# Altium project SoM_RK3588.PrjPcb (part 6 of 6)
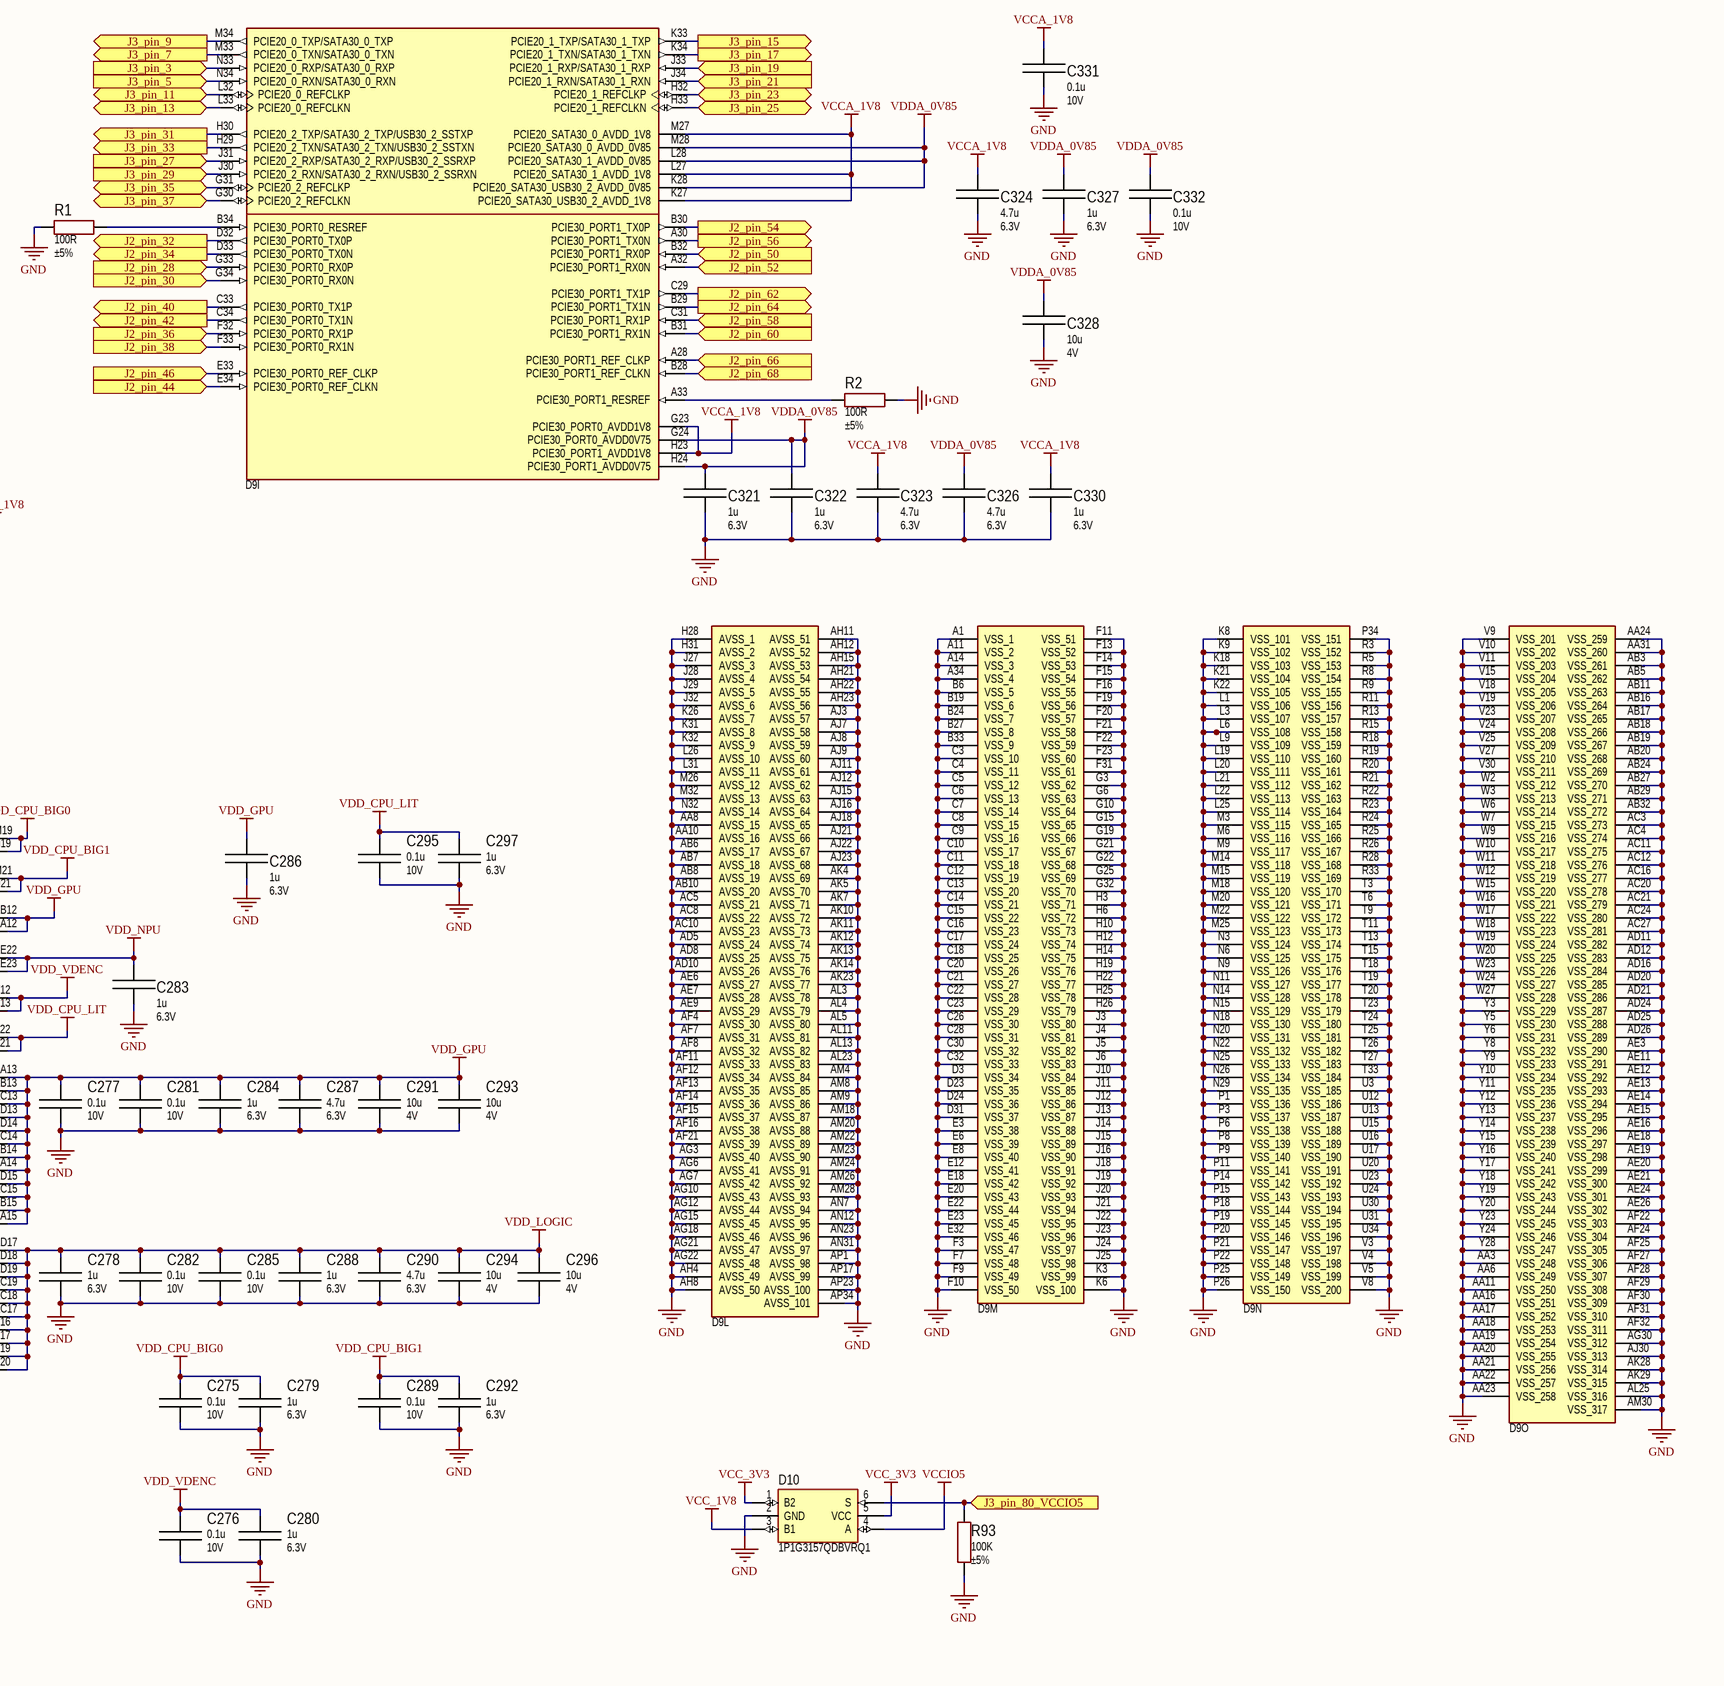
[diagram p25: 06_RK3588MQ.SchDoc, bottom right]

## Sheet 06_RK3588MQ.SchDoc (continued)

### Library data of the parts
C193 C197 = C1005C0G1H180J050BA: Ceramic capacitor, 18pF, C0G, ±5%, 50V, 0402, -55...+125°C; Manufacturer: TDK; Type: Ceramic SMD; PartNumber: C1005C0G1H180J050BA; Dielectric: C0G; Tolerance: ±5%; Temperature: -55...+125°C; Package: 0402; ComponentLink1Description: Link; ComponentLink1URL: https://product.tdk.com/en/system/files/dam/doc/product/capacitor/ceramic/mlcc/catalog/mlcc_commercial_general_en.pdf; ComponentLink2Description: LocalLink; ComponentLink2URL: C:\Users\Public\Documents\Altium\datasheet\Capacitors\mlcc_commercial_general_en.pdf
C194 C196 C200 C204 C207 C209-C211 C215 C217 C228 C233 C236 C240 C247 C257-C259 C261-C263 C265 C266 C278-C280 C283 C284 C286 C288 C292 C297 C304 C310 C313 C317 C319 C321 C322 C327 C330 = C0603X5R0J105M030BC: Ceramic capacitor, 1uF, X5R, ±20%, 6.3V, 0201, -55...+85°C; Manufacturer: TDK; Type: Ceramic SMD; PartNumber: C0603X5R0J105M030BC; Dielectric: X5R; Tolerance: ±20%; Temperature: -55...+85°C; Package: 0201; ComponentLink1Description: Link; ComponentLink1URL: https://product.tdk.com/system/files/dam/doc/product/capacitor/ceramic/mlcc/catalog/mlcc_commercial_general_en.pdf; ComponentLink2Description: LocalLink; ComponentLink2URL: C:\Users\Public\Documents\Altium\datasheet\Capacitors\mlcc_commercial_general_en.pdf
C195 C198 C199 C201-C203 C212 C214 C219 C220 C223 C241 C246 C253 C254 C260 C267-C272 C274-C277 C281 C282 C285 C289 C295 C303 C305-C309 C311 C314 C316 C325 C329 C331-C352 = C0603X5R1A104K030BC: Ceramic capacitor, 0.1uF, X5R, ±10%, 10V, 0201, -55...+85°C; Manufacturer: TDK; Type: Ceramic SMD; PartNumber: C0603X5R1A104K030BC; Dielectric: X5R; Tolerance: ±10%; Temperature: -55...+85°C; Package: 0201; ComponentLink1Description: Link; ComponentLink1URL: https://product.tdk.com/system/files/dam/doc/product/capacitor/ceramic/mlcc/catalog/mlcc_commercial_general_en.pdf; ComponentLink2Description: LocalLink; ComponentLink2URL: C:\Users\Public\Documents\Altium\datasheet\Capacitors\mlcc_commercial_general_en.pdf
C205 C206 C227 C230 C243-C245 C249 C252 C255 C256 C291 C293 C294 C296 C328 = CC0402MRX5R4BB106: Ceramic capacitor, 10uF, X5R, ±20%, 4V, 0402, -55...+85°C; Manufacturer: Yageo; Type: Ceramic SMD; Tolerance: ±5%; PartNumber: CC0402MRX5R4BB106; Dielectric: X5R; Temperature: -55...+85°C; Package: 0402; ComponentLink1Description: Link; ComponentLink1URL: https://www.yageo.com/upload/media/product/productsearch/datasheet/mlcc/UPY-GPHC_X5R_4V-to-50V_30.pdf; ComponentLink2Description: LocalLink; ComponentLink2URL: C:\Users\Public\Documents\Altium\datasheet\Capacitors\UPY-GPHC_X5R_4V-to-50V_30.pdf
C208 C234 C250 C251 C264 C287 C290 C312 C318 C320 C323 C324 C326 = C1005X5R0J475K050BC: Ceramic capacitor, 4,7uF, X5R, ±10%, 6.3V, 0402, -55...+85°C; Manufacturer: TDK; Type: Ceramic SMD; PartNumber: C1005X5R0J475K050BC; Dielectric: X5R; Tolerance: ±10%; Temperature: -55...+85°C; Package: 0402; ComponentLink1Description: Link; ComponentLink1URL: https://product.tdk.com/en/system/files/dam/doc/product/capacitor/ceramic/mlcc/catalog/mlcc_commercial_general_en.pdf; ComponentLink2Description: LocalLink; ComponentLink2URL: C:\Users\Public\Documents\Altium\datasheet\Capacitors\mlcc_commercial_general_en.pdf
C225 C232 C235 C248 = C1608X5R0J226M080AC: Ceramic capacitor, 22uF, X5R, ±20%, 6.3V, 0603, -55...+85°C; Manufacturer: TDK; Type: Ceramic SMD; PartNumber: C1608X5R0J226M080AC; Dielectric: X5R; Tolerance: ±20%; Temperature: -55...+85°C; Package: 0603; ComponentLink1Description: Link; ComponentLink1URL: https://product.tdk.com/system/files/dam/doc/product/capacitor/ceramic/mlcc/catalog/mlcc_commercial_general_en.pdf; ComponentLink2Description: LocalLink; ComponentLink2URL: C:\Users\Public\Documents\Altium\datasheet\Capacitors\mlcc_commercial_general_en.pdf
C273 = C1608X5R0J106K080AB: Ceramic capacitor, 10uF, X5R, ±10%, 6.3V, 0603, -55...+85°C; Manufacturer: TDK; Type: Ceramic SMD; PartNumber: C1608X5R0J106K080AB; Dielectric: X5R; Tolerance: ±10%; Temperature: -55...+85°C; Package: 0603; ComponentLink1Description: Link; ComponentLink1URL: https://product.tdk.com/system/files/dam/doc/product/capacitor/ceramic/mlcc/catalog/mlcc_commercial_general_en.pdf; ComponentLink2Description: LocalLink; ComponentLink2URL: C:\Users\Public\Documents\Altium\datasheet\Capacitors\mlcc_commercial_general_en.pdf
D9 = RK3588M: A high perfomance, low power AIoT processor; Manufacturer: Rockchip; PartNumber: RK3588M; Type: Processor; Package: FCBGA1088L; ComponentLink1Description: New link; ComponentLink1URL: C:\Users\Public\Documents\Altium\Datasheet\ICs\Rockchip_RK3588_Datasheet_V1.3-20220328.pdf; Temperature: -40...+125°C
D10 = 1P1G3157QDBVRQ1: Automotive Single-Pole Double-Throw Analog Switch; Manufacturer: Texas Instruments; ComponentLink1Description: Link; ComponentLink1URL: https://www.ti.com/lit/ds/symlink/sn74lvc1g3157-q1.pdf?ts=1743508565257&ref_url=https%253A%252F%252Fwww.ti.com%252Fproduct%252FSN74LVC1G3157-Q1; ComponentLink2Description: LocalLink; ComponentLink2URL: C:\Users\Public\Documents\Altium\Datasheet\ICs\sn74lvc1g3157-q1.pdf; Type: Analog Switch; Temperature: -40...+125°C; Package: SOT-23 (6); PartNumber: 1P1G3157QDBVRQ1
R1 R2 = RC0402JR-07100RL: Resistor film, 100R, ±5%, 0402, 0.0625W, -55...+155°C; Manufacturer: Yageo; PartNumber: RC0402JR-07100RL; Type: Resistor film; Power: 0.0625W; ComponentLink1Description: Link; ComponentLink1URL: https://www.yageo.com/upload/media/product/productsearch/datasheet/rchip/PYu-RC_Group_51_RoHS_L_12.pdf; Temperature: -55...+155°C; Package: 0402; ComponentLink2Description: LocalLink; ComponentLink2URL: C:\Users\Public\Documents\Altium\Datasheet\Resistors\PYu-RC_Group_51_RoHS_L_12.pdf
R73 R76 R81 R82 = RC0201FR-07240RL: Resistor film, 240R, ±1%, 0201, 0.05W, -55...+125°C; Manufacturer: Yageo; PartNumber: RC0201FR-07240RL; Type: Resistor film; Power: 0.05W; ComponentLink1Description: Link; ComponentLink1URL: https://www.yageo.com/upload/media/product/productsearch/datasheet/rchip/PYu-RC_Group_51_RoHS_L_12.pdf; Temperature: -55...+125°C; Package: 0201; ComponentLink2Description: LocalLink; ComponentLink2URL: C:\Users\Public\Documents\Altium\Datasheet\Resistors\PYu-RC_Group_51_RoHS_L_12.pdf
R74 R77 R87 R91 = RC0402JR-0722RL: Resistor film, 22R, ±5%, 0402, 0.0625W, -55...+155°C; Manufacturer: Yageo; PartNumber: RC0402JR-0722RL; Type: Resistor film; Power: 0.0625W; ComponentLink1Description: Link; ComponentLink1URL: https://www.yageo.com/upload/media/product/productsearch/datasheet/rchip/PYu-RC_Group_51_RoHS_L_12.pdf; Temperature: -55...+155°C; Package: 0402; ComponentLink2Description: LocalLink; ComponentLink2URL: C:\Users\Public\Documents\Altium\Datasheet\Resistors\PYu-RC_Group_51_RoHS_L_12.pdf
R75 = RC0402JR-07510KL: Resistor film, 510K, ±5%, 0402, 0.0625W, -55...+155°C; Manufacturer: Yageo; PartNumber: RC0402JR-07510KL; Type: Resistor film; Power: 0.0625W; ComponentLink1Description: Link; ComponentLink1URL: https://www.yageo.com/upload/media/product/productsearch/datasheet/rchip/PYu-RC_Group_51_RoHS_L_12.pdf; Temperature: -55...+155°C; Package: 0402; ComponentLink2Description: LocalLink; ComponentLink2URL: C:\Users\Public\Documents\Altium\Datasheet\Resistors\PYu-RC_Group_51_RoHS_L_12.pdf
R78 R85 R93 = RC0402JR-07100KL: Resistor film, 100K, ±5%, 0402, 0.0625W, -55...+155°C; Manufacturer: Yageo; PartNumber: RC0402JR-07100KL; Type: Resistor film; Power: 0.0625W; ComponentLink1Description: Link; ComponentLink1URL: https://www.yageo.com/upload/media/product/productsearch/datasheet/rchip/PYu-RC_Group_51_RoHS_L_12.pdf; Temperature: -55...+155°C; Package: 0402; ComponentLink2Description: LocalLink; ComponentLink2URL: C:\Users\Public\Documents\Altium\Datasheet\Resistors\PYu-RC_Group_51_RoHS_L_12.pdf
R79 R94-R97 = NC0402: NC, No BOM; PartNumber: NC; Type: Resistor film; Package: 0402
R80 R86 = RC0402JR-07120KL: Resistor film, 120K, ±5%, 0402, 0.0625W, -55...+155°C; Manufacturer: Yageo; PartNumber: RC0402JR-07120KL; Type: Resistor film; Power: 0.0625W; ComponentLink1Description: Link; ComponentLink1URL: https://www.yageo.com/upload/media/product/productsearch/datasheet/rchip/PYu-RC_Group_51_RoHS_L_12.pdf; Temperature: -55...+155°C; Package: 0402; ComponentLink2Description: LocalLink; ComponentLink2URL: C:\Users\Public\Documents\Altium\Datasheet\Resistors\PYu-RC_Group_51_RoHS_L_12.pdf
R83 R84 = RC0201JR-072K2L: Resistor film, 2K2, ±5%, 0201, 0.05W, -55...+125°C; Manufacturer: Yageo; PartNumber: RC0201JR-072K2L; Type: Resistor film; Power: 0.05W; ComponentLink1Description: Link; ComponentLink1URL: https://www.yageo.com/upload/media/product/productsearch/datasheet/rchip/PYu-RC_Group_51_RoHS_L_12.pdf; Temperature: -55...+125°C; Package: 0201; ComponentLink2Description: LocalLink; ComponentLink2URL: C:\Users\Public\Documents\Altium\Datasheet\Resistors\PYu-RC_Group_51_RoHS_L_12.pdf
R88 R89 = RC0603JR-070RL: Resistor film, 0R, 0603, 0.1W, -55...+155°C; Manufacturer: Yageo; PartNumber: RC0603JR-070RL; Type: Resistor film; Power: 0.1W; ComponentLink1Description: Link; ComponentLink1URL: https://www.yageo.com/upload/media/product/productsearch/datasheet/rchip/PYu-RC_Group_51_RoHS_L_12.pdf; Temperature: -55...+155°C; Package: 0603; ComponentLink2Description: LocalLink; ComponentLink2URL: C:\Users\Public\Documents\Altium\Datasheet\Resistors\PYu-RC_Group_51_RoHS_L_12.pdf
R90 R92 = RC0201JR-070RL: Resistor film, 0R, 0201, 0.05W, -55...+155°C; Manufacturer: Yageo; PartNumber: RC0201JR-070RL; Type: Resistor film; Power: 0.05W; ComponentLink1Description: Link; ComponentLink1URL: https://www.yageo.com/upload/media/product/productsearch/datasheet/rchip/PYu-RC_Group_51_RoHS_L_12.pdf; Temperature: -55...+155°C; Package: 0201; ComponentLink2Description: LocalLink; ComponentLink2URL: C:\Users\Public\Documents\Altium\Datasheet\Resistors\PYu-RC_Group_51_RoHS_L_12.pdf
ZQ1 = E3SB24.0000F08E11: Surface Mount Crystal Oscillator, 24MHz; Manufacturer: Hosonic; ComponentLink1Description: Link; ComponentLink1URL: https://hosonic.com/Upload/202409/product_2024092818084106.pdf; ComponentLink2Description: LocalLink; ComponentLink2URL: C:\Users\Public\Documents\Altium\Datasheet\ICs\product_2024092818084106.pdf; Type: Crystal Oscillators; Temperature: -40...+85°C; Package: 3.2 x 2.5 x 0.7mm ceramic package; PartNumber: E3SB24.0000F08E11; Value: 24MHz

## Sheet 07_J1_CONN.SchDoc
size 420 x 297 mm; SheetNumber: 7; SheetTotal: 8
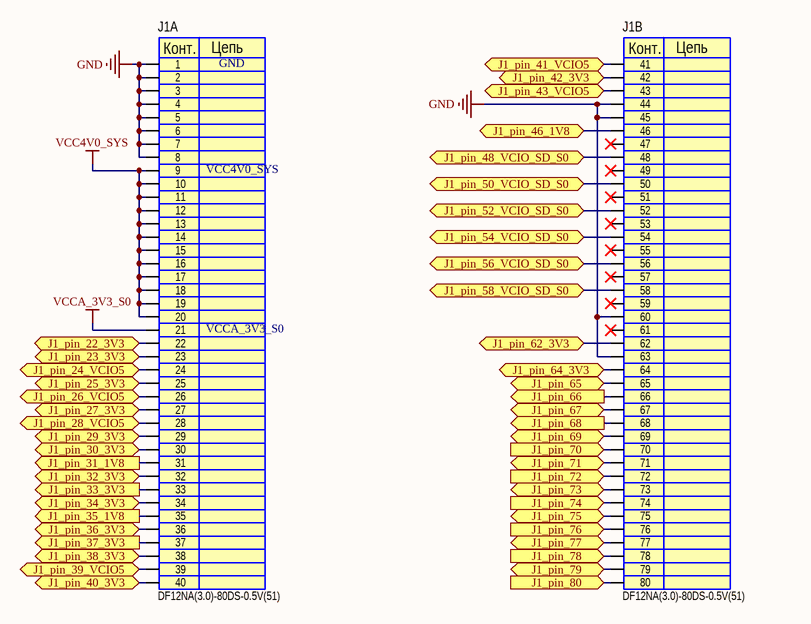
[diagram p19: 07_J1_CONN.SchDoc]

### Parts
J1  DF12NA(3.0)-80DS-0.5V(51)  [CONN_DF12NA3.0-80DS-0.5V51_HIR]  (parts A,B of 2)

### Ports
J1_pin_22_3V3 (bidir), J1_pin_23_3V3 (bidir), J1_pin_24_VCIO5 (bidir), J1_pin_25_3V3 (bidir), J1_pin_26_VCIO5 (bidir), J1_pin_27_3V3 (bidir), J1_pin_28_VCIO5 (bidir), J1_pin_29_3V3 (bidir), J1_pin_30_3V3 (bidir), J1_pin_31_1V8 (out), J1_pin_32_3V3 (bidir), J1_pin_33_3V3 (out), J1_pin_34_3V3 (bidir), J1_pin_35_1V8 (out), J1_pin_36_3V3 (bidir), J1_pin_37_3V3 (out), J1_pin_38_3V3 (bidir), J1_pin_39_VCIO5 (bidir), J1_pin_40_3V3 (bidir), J1_pin_41_VCIO5 (bidir), J1_pin_42_3V3 (bidir), J1_pin_43_VCIO5 (bidir), J1_pin_46_1V8 (bidir), J1_pin_48_VCIO_SD_S0 (bidir), J1_pin_50_VCIO_SD_S0 (bidir), J1_pin_52_VCIO_SD_S0 (bidir), J1_pin_54_VCIO_SD_S0 (bidir), J1_pin_56_VCIO_SD_S0 (bidir), J1_pin_58_VCIO_SD_S0 (bidir), J1_pin_62_3V3 (bidir), J1_pin_64_3V3 (bidir), J1_pin_65 (bidir), J1_pin_66 (out), J1_pin_67 (bidir), J1_pin_68 (out), J1_pin_69 (bidir), J1_pin_70 (in), J1_pin_71 (bidir), J1_pin_72 (in), J1_pin_73 (bidir), J1_pin_74 (in), J1_pin_75 (bidir), J1_pin_76 (in), J1_pin_77 (bidir), J1_pin_78 (in), J1_pin_79 (bidir), J1_pin_80 (in)

### Nets
GND: J1.1 J1.2 J1.3 J1.4 J1.5 J1.6 J1.7 J1.8 J1.44 J1.45 J1.60 J1.63
VCC4V0_SYS: J1.9 J1.10 J1.11 J1.12 J1.13 J1.14 J1.15 J1.16 J1.17 J1.18 J1.19 J1.20
VCCA_3V3_S0: J1.21
J1_pin_22_3V3: J1.22 ; port J1_pin_22_3V3
J1_pin_23_3V3: J1.23 ; port J1_pin_23_3V3
J1_pin_24_VCIO5: J1.24 ; port J1_pin_24_VCIO5
J1_pin_25_3V3: J1.25 ; port J1_pin_25_3V3
J1_pin_26_VCIO5: J1.26 ; port J1_pin_26_VCIO5
J1_pin_27_3V3: J1.27 ; port J1_pin_27_3V3
J1_pin_28_VCIO5: J1.28 ; port J1_pin_28_VCIO5
J1_pin_29_3V3: J1.29 ; port J1_pin_29_3V3
J1_pin_30_3V3: J1.30 ; port J1_pin_30_3V3
J1_pin_31_1V8: J1.31 ; port J1_pin_31_1V8
J1_pin_32_3V3: J1.32 ; port J1_pin_32_3V3
J1_pin_33_3V3: J1.33 ; port J1_pin_33_3V3
J1_pin_34_3V3: J1.34 ; port J1_pin_34_3V3
J1_pin_35_1V8: J1.35 ; port J1_pin_35_1V8
J1_pin_36_3V3: J1.36 ; port J1_pin_36_3V3
J1_pin_37_3V3: J1.37 ; port J1_pin_37_3V3
J1_pin_38_3V3: J1.38 ; port J1_pin_38_3V3
J1_pin_39_VCIO5: J1.39 ; port J1_pin_39_VCIO5
J1_pin_40_3V3: J1.40 ; port J1_pin_40_3V3
J1_pin_41_VCIO5: J1.41 ; port J1_pin_41_VCIO5
J1_pin_42_3V3: J1.42 ; port J1_pin_42_3V3
J1_pin_43_VCIO5: J1.43 ; port J1_pin_43_VCIO5
J1_pin_46_1V8: J1.46 ; port J1_pin_46_1V8
J1_pin_48_VCIO_SD_S0: J1.48 ; port J1_pin_48_VCIO_SD_S0
J1_pin_50_VCIO_SD_S0: J1.50 ; port J1_pin_50_VCIO_SD_S0
J1_pin_52_VCIO_SD_S0: J1.52 ; port J1_pin_52_VCIO_SD_S0
J1_pin_54_VCIO_SD_S0: J1.54 ; port J1_pin_54_VCIO_SD_S0
J1_pin_56_VCIO_SD_S0: J1.56 ; port J1_pin_56_VCIO_SD_S0
J1_pin_58_VCIO_SD_S0: J1.58 ; port J1_pin_58_VCIO_SD_S0
J1_pin_62_3V3: J1.62 ; port J1_pin_62_3V3
J1_pin_64_3V3: J1.64 ; port J1_pin_64_3V3
J1_pin_65: J1.65 ; port J1_pin_65
J1_pin_66: J1.66 ; port J1_pin_66
J1_pin_67: J1.67 ; port J1_pin_67
J1_pin_68: J1.68 ; port J1_pin_68
J1_pin_69: J1.69 ; port J1_pin_69
J1_pin_70: J1.70 ; port J1_pin_70
J1_pin_71: J1.71 ; port J1_pin_71
J1_pin_72: J1.72 ; port J1_pin_72
J1_pin_73: J1.73 ; port J1_pin_73
J1_pin_74: J1.74 ; port J1_pin_74
J1_pin_75: J1.75 ; port J1_pin_75
J1_pin_76: J1.76 ; port J1_pin_76
J1_pin_77: J1.77 ; port J1_pin_77
J1_pin_78: J1.78 ; port J1_pin_78
J1_pin_79: J1.79 ; port J1_pin_79
J1_pin_80: J1.80 ; port J1_pin_80

Not connected (* = marked no-connect by the designer): J1 47* 49* 51* 53* 55* 57* 59* 61*

### Notes on the sheet
- GND
- (near J1) VCC4V0_SYS
- (near J1) VCCA_3V3_S0
- THIS DOCUMENT AND THE DATA DISCLOSED HEREIN OR
- HEREWITH IS THE PROPERTY OF ALTIUM LIMITED AND MAY
- DWG NO:
- REVISION
- REV:
- DESCRIPTION
- DATE
- APPROVED
- BE FREELY DISTRIBUTED IN WHOLE. NO RIGHTS ARE
- RESERVED OR EXPRESS OR IMPLIED WARANTEE GIVEN.
- ENG:
- APPROVALS
- PROJECT
- DSN:
- CHK:
- REFERENCE DOCUMENTS
- PROJECT REVISION:
- TITLE
- DOCUMENT REVISION:
- DESIGN ITEM:
- BOM:
- FAB DWG:
- PCB DWG:
- ASSY DWG:
- SCALE:
- A3
- SIZE
- CAGE CODE
- FILE NAME
- DWG NO.
- SHEET
- OF
- REV
- (in symbol DF12NA(3.0)-80DS-0.5V(51), part A) Конт.; Цепь
- (in symbol DF12NA(3.0)-80DS-0.5V(51), part B) Конт.; Цепь

### Library data of the parts
J1 = DF12NA(3.0)-80DS-0.5V(51): 0.5mm Pitch SMT Board-to-Board Connector; Manufacturer: Hirose; Row: 2; Positions: 80; Male/Female: F; ComponentLink1Description: Link; ComponentLink2Description: LocalLink; ComponentLink2URL: C:\Users\Public\Documents\Altium\Datasheet\Connectors\DF12NA(3.0)-80DS-0.5V(51).pdf; Type: Board-to-Board; Temperature: -40...+105°C; PartNumber: DF12NA(3.0)-80DS-0.5V(51)

## Sheet 08_J2_CONN.SchDoc
size 420 x 297 mm; SheetNumber: 8; SheetTotal: 8
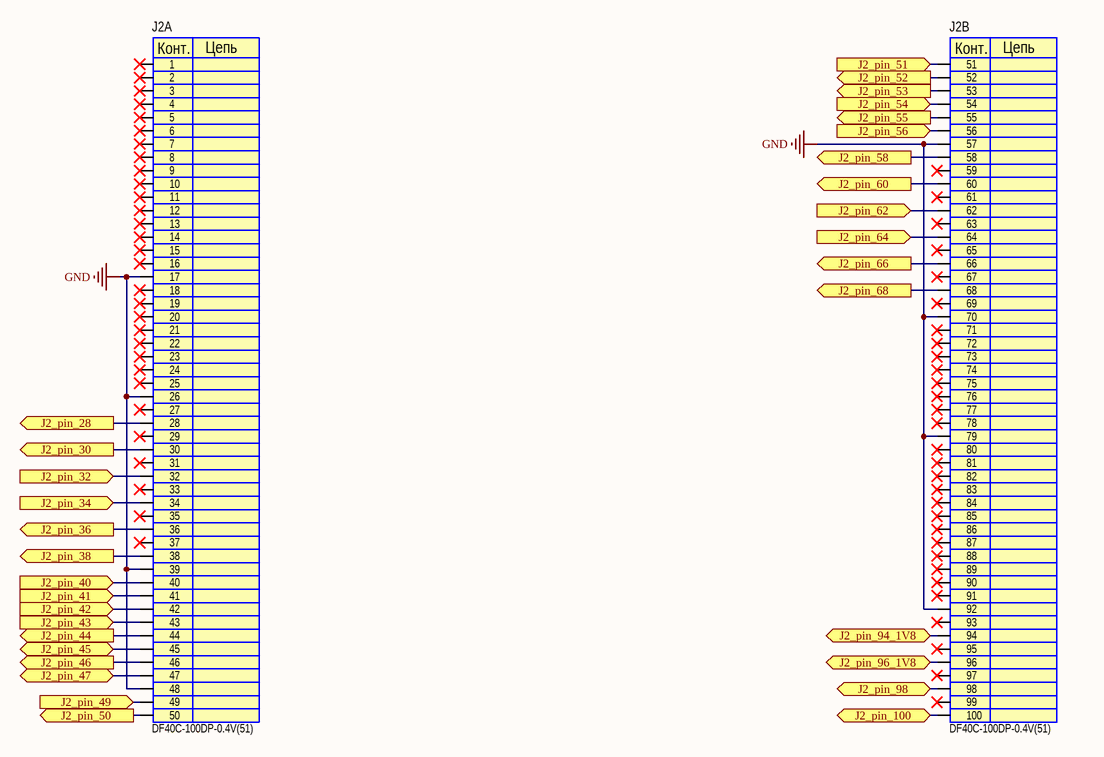
[diagram p20: 08_J2_CONN.SchDoc]

### Parts
J2  DF40C-100DP-0.4V(51)  [CONN100_DF40C-100DP-0.4V51_HIR]  (parts A,B of 2)

### Ports
J2_pin_28 (out), J2_pin_30 (out), J2_pin_32 (in), J2_pin_34 (in), J2_pin_36 (out), J2_pin_38 (out), J2_pin_40 (in), J2_pin_41 (in), J2_pin_42 (in), J2_pin_43 (in), J2_pin_44 (out), J2_pin_45 (bidir), J2_pin_46 (out), J2_pin_47 (bidir), J2_pin_49 (in), J2_pin_50 (out), J2_pin_51 (in), J2_pin_52 (out), J2_pin_53 (out), J2_pin_54 (in), J2_pin_55 (out), J2_pin_56 (in), J2_pin_58 (out), J2_pin_60 (out), J2_pin_62 (in), J2_pin_64 (in), J2_pin_66 (out), J2_pin_68 (out), J2_pin_94_1V8 (bidir), J2_pin_96_1V8 (bidir), J2_pin_98 (bidir), J2_pin_100 (bidir)

### Nets
GND: J2.17 J2.26 J2.39 J2.48 J2.57 J2.70 J2.79 J2.92
J2_pin_28: J2.28 ; port J2_pin_28
J2_pin_30: J2.30 ; port J2_pin_30
J2_pin_32: J2.32 ; port J2_pin_32
J2_pin_34: J2.34 ; port J2_pin_34
J2_pin_36: J2.36 ; port J2_pin_36
J2_pin_38: J2.38 ; port J2_pin_38
J2_pin_40: J2.40 ; port J2_pin_40
J2_pin_41: J2.41 ; port J2_pin_41
J2_pin_42: J2.42 ; port J2_pin_42
J2_pin_43: J2.43 ; port J2_pin_43
J2_pin_44: J2.44 ; port J2_pin_44
J2_pin_45: J2.45 ; port J2_pin_45
J2_pin_46: J2.46 ; port J2_pin_46
J2_pin_47: J2.47 ; port J2_pin_47
J2_pin_49: J2.49 ; port J2_pin_49
J2_pin_50: J2.50 ; port J2_pin_50
J2_pin_51: J2.51 ; port J2_pin_51
J2_pin_52: J2.52 ; port J2_pin_52
J2_pin_53: J2.53 ; port J2_pin_53
J2_pin_54: J2.54 ; port J2_pin_54
J2_pin_55: J2.55 ; port J2_pin_55
J2_pin_56: J2.56 ; port J2_pin_56
J2_pin_58: J2.58 ; port J2_pin_58
J2_pin_60: J2.60 ; port J2_pin_60
J2_pin_62: J2.62 ; port J2_pin_62
J2_pin_64: J2.64 ; port J2_pin_64
J2_pin_66: J2.66 ; port J2_pin_66
J2_pin_68: J2.68 ; port J2_pin_68
J2_pin_94_1V8: J2.94 ; port J2_pin_94_1V8
J2_pin_96_1V8: J2.96 ; port J2_pin_96_1V8
J2_pin_98: J2.98 ; port J2_pin_98
J2_pin_100: J2.100 ; port J2_pin_100

Not connected (* = marked no-connect by the designer): J2 1* 2* 3* 4* 5* 6* 7* 8* 9* 10* 11* 12* 13* 14* 15* 16* 18* 19* 20* 21* 22* 23* 24* 25* 27* 29* 31* 33* 35* 37* 59* 61* 63* 65* 67* 69* 71* 72* 73* 74* 75* 76* 77* 78* 80* 81* 82* 83* 84* 85* 86* 87* 88* 89* 90* 91* 93* 95* 97* 99*

### Notes on the sheet
- THIS DOCUMENT AND THE DATA DISCLOSED HEREIN OR
- HEREWITH IS THE PROPERTY OF ALTIUM LIMITED AND MAY
- DWG NO:
- REVISION
- REV:
- DESCRIPTION
- DATE
- APPROVED
- BE FREELY DISTRIBUTED IN WHOLE. NO RIGHTS ARE
- RESERVED OR EXPRESS OR IMPLIED WARANTEE GIVEN.
- ENG:
- APPROVALS
- PROJECT
- DSN:
- CHK:
- REFERENCE DOCUMENTS
- PROJECT REVISION:
- TITLE
- DOCUMENT REVISION:
- DESIGN ITEM:
- BOM:
- FAB DWG:
- PCB DWG:
- ASSY DWG:
- SCALE:
- A3
- SIZE
- CAGE CODE
- FILE NAME
- DWG NO.
- SHEET
- OF
- REV
- (in symbol DF40C-100DP-0.4V(51), part A) Конт.; Цепь
- (in symbol DF40C-100DP-0.4V(51), part B) Конт.; Цепь

### Library data of the parts
J2 = DF40C-100DP-0.4V(51): 0.5mm Pitch SMT Board-to-Board Connector; Manufacturer: Hirose; Row: 2; Positions: 100; Male/Female: F; ComponentLink1Description: Link; ComponentLink1URL: https://www.hirose.com/ru/product/document?clcode=CL0684-4032-1-51&productname=DF40C-100DP-0.4V(51)&series=DF40&documenttype=2DDrawing&lang=ru&documentid=0001001212; ComponentLink2Description: LocalLink; ComponentLink2URL: C:\Users\Public\Documents\Altium\Datasheet\Connectors\DF40C-100DP-0.4V(51)_CL0684-4032-1-51_2DDrawing_0001001212.pdf; Type: Board-to-Board; Temperature: -40...+105°C; PartNumber: DF40C-100DP-0.4V(51)

## Sheet 09_J3_CONN.SchDoc
size 420 x 297 mm; SheetNumber: 9; SheetTotal: 9
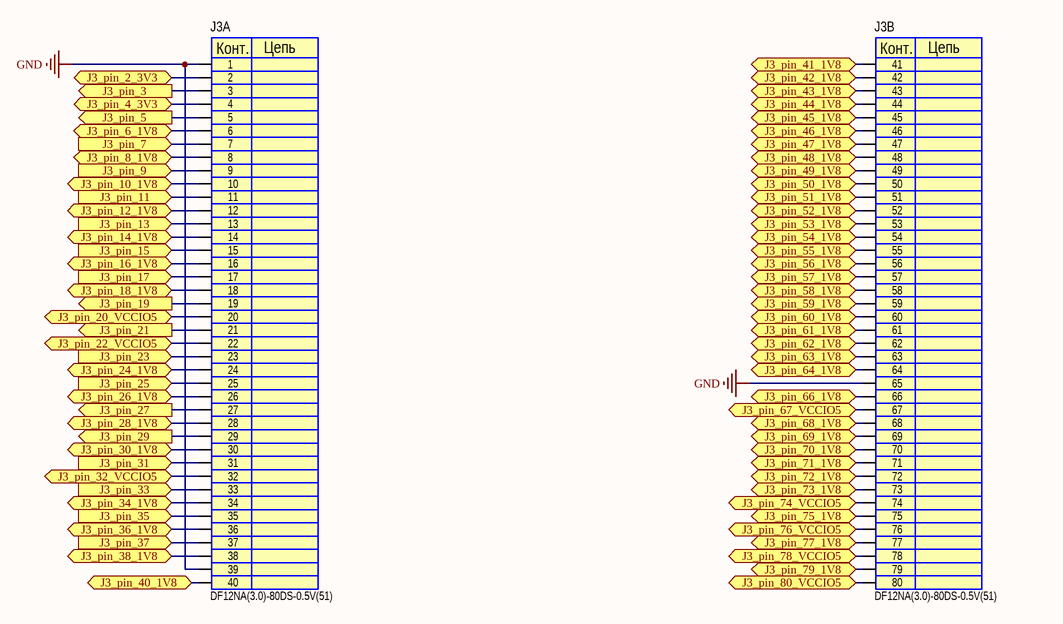
[diagram p21: 09_J3_CONN.SchDoc]

### Parts
J3  DF12NA(3.0)-80DS-0.5V(51)  [CONN_DF12NA3.0-80DS-0.5V51_HIR]  (parts A,B of 2)

### Ports
J3_pin_2_3V3 (bidir), J3_pin_3 (out), J3_pin_4_3V3 (bidir), J3_pin_5 (out), J3_pin_6_1V8 (bidir), J3_pin_7 (in), J3_pin_8_1V8 (bidir), J3_pin_9 (in), J3_pin_10_1V8 (bidir), J3_pin_11 (in), J3_pin_12_1V8 (bidir), J3_pin_13 (in), J3_pin_14_1V8 (bidir), J3_pin_15 (in), J3_pin_16_1V8 (bidir), J3_pin_17 (in), J3_pin_18_1V8 (bidir), J3_pin_19 (out), J3_pin_20_VCCIO5 (bidir), J3_pin_21 (out), J3_pin_22_VCCIO5 (bidir), J3_pin_23 (in), J3_pin_24_1V8 (bidir), J3_pin_25 (in), J3_pin_26_1V8 (bidir), J3_pin_27 (out), J3_pin_28_1V8 (bidir), J3_pin_29 (out), J3_pin_30_1V8 (bidir), J3_pin_31 (in), J3_pin_32_VCCIO5 (bidir), J3_pin_33 (in), J3_pin_34_1V8 (bidir), J3_pin_35 (in), J3_pin_36_1V8 (bidir), J3_pin_37 (in), J3_pin_38_1V8 (bidir), J3_pin_40_1V8 (bidir), J3_pin_41_1V8 (bidir), J3_pin_42_1V8 (bidir), J3_pin_43_1V8 (bidir), J3_pin_44_1V8 (bidir), J3_pin_45_1V8 (bidir), J3_pin_46_1V8 (bidir), J3_pin_47_1V8 (bidir), J3_pin_48_1V8 (bidir), J3_pin_49_1V8 (bidir), J3_pin_50_1V8 (bidir), J3_pin_51_1V8 (bidir), J3_pin_52_1V8 (bidir), J3_pin_53_1V8 (bidir), J3_pin_54_1V8 (bidir), J3_pin_55_1V8 (bidir), J3_pin_56_1V8 (bidir), J3_pin_57_1V8 (bidir), J3_pin_58_1V8 (bidir), J3_pin_59_1V8 (bidir), J3_pin_60_1V8 (bidir), J3_pin_61_1V8 (bidir), J3_pin_62_1V8 (bidir), J3_pin_63_1V8 (bidir), J3_pin_64_1V8 (bidir), J3_pin_66_1V8 (bidir), J3_pin_67_VCCIO5 (bidir), J3_pin_68_1V8 (bidir), J3_pin_69_1V8 (bidir), J3_pin_70_1V8 (bidir), J3_pin_71_1V8 (bidir), J3_pin_72_1V8 (bidir), J3_pin_73_1V8 (bidir), J3_pin_74_VCCIO5 (bidir), J3_pin_75_1V8 (bidir), J3_pin_76_VCCIO5 (bidir), J3_pin_77_1V8 (bidir), J3_pin_78_VCCIO5 (bidir), J3_pin_79_1V8 (bidir), J3_pin_80_VCCIO5 (bidir)

### Nets
GND: J3.1 J3.39 J3.65
J3_pin_2_3V3: J3.2 ; port J3_pin_2_3V3
J3_pin_3: J3.3 ; port J3_pin_3
J3_pin_4_3V3: J3.4 ; port J3_pin_4_3V3
J3_pin_5: J3.5 ; port J3_pin_5
J3_pin_6_1V8: J3.6 ; port J3_pin_6_1V8
J3_pin_7: J3.7 ; port J3_pin_7
J3_pin_8_1V8: J3.8 ; port J3_pin_8_1V8
J3_pin_9: J3.9 ; port J3_pin_9
J3_pin_10_1V8: J3.10 ; port J3_pin_10_1V8
J3_pin_11: J3.11 ; port J3_pin_11
J3_pin_12_1V8: J3.12 ; port J3_pin_12_1V8
J3_pin_13: J3.13 ; port J3_pin_13
J3_pin_14_1V8: J3.14 ; port J3_pin_14_1V8
J3_pin_15: J3.15 ; port J3_pin_15
J3_pin_16_1V8: J3.16 ; port J3_pin_16_1V8
J3_pin_17: J3.17 ; port J3_pin_17
J3_pin_18_1V8: J3.18 ; port J3_pin_18_1V8
J3_pin_19: J3.19 ; port J3_pin_19
J3_pin_20_VCCIO5: J3.20 ; port J3_pin_20_VCCIO5
J3_pin_21: J3.21 ; port J3_pin_21
J3_pin_22_VCCIO5: J3.22 ; port J3_pin_22_VCCIO5
J3_pin_23: J3.23 ; port J3_pin_23
J3_pin_24_1V8: J3.24 ; port J3_pin_24_1V8
J3_pin_25: J3.25 ; port J3_pin_25
J3_pin_26_1V8: J3.26 ; port J3_pin_26_1V8
J3_pin_27: J3.27 ; port J3_pin_27
J3_pin_28_1V8: J3.28 ; port J3_pin_28_1V8
J3_pin_29: J3.29 ; port J3_pin_29
J3_pin_30_1V8: J3.30 ; port J3_pin_30_1V8
J3_pin_31: J3.31 ; port J3_pin_31
J3_pin_32_VCCIO5: J3.32 ; port J3_pin_32_VCCIO5
J3_pin_33: J3.33 ; port J3_pin_33
J3_pin_34_1V8: J3.34 ; port J3_pin_34_1V8
J3_pin_35: J3.35 ; port J3_pin_35
J3_pin_36_1V8: J3.36 ; port J3_pin_36_1V8
J3_pin_37: J3.37 ; port J3_pin_37
J3_pin_38_1V8: J3.38 ; port J3_pin_38_1V8
J3_pin_40_1V8: J3.40 ; port J3_pin_40_1V8
J3_pin_41_1V8: J3.41 ; port J3_pin_41_1V8
J3_pin_42_1V8: J3.42 ; port J3_pin_42_1V8
J3_pin_43_1V8: J3.43 ; port J3_pin_43_1V8
J3_pin_44_1V8: J3.44 ; port J3_pin_44_1V8
J3_pin_45_1V8: J3.45 ; port J3_pin_45_1V8
J3_pin_46_1V8: J3.46 ; port J3_pin_46_1V8
J3_pin_47_1V8: J3.47 ; port J3_pin_47_1V8
J3_pin_48_1V8: J3.48 ; port J3_pin_48_1V8
J3_pin_49_1V8: J3.49 ; port J3_pin_49_1V8
J3_pin_50_1V8: J3.50 ; port J3_pin_50_1V8
J3_pin_51_1V8: J3.51 ; port J3_pin_51_1V8
J3_pin_52_1V8: J3.52 ; port J3_pin_52_1V8
J3_pin_53_1V8: J3.53 ; port J3_pin_53_1V8
J3_pin_54_1V8: J3.54 ; port J3_pin_54_1V8
J3_pin_55_1V8: J3.55 ; port J3_pin_55_1V8
J3_pin_56_1V8: J3.56 ; port J3_pin_56_1V8
J3_pin_57_1V8: J3.57 ; port J3_pin_57_1V8
J3_pin_58_1V8: J3.58 ; port J3_pin_58_1V8
J3_pin_59_1V8: J3.59 ; port J3_pin_59_1V8
J3_pin_60_1V8: J3.60 ; port J3_pin_60_1V8
J3_pin_61_1V8: J3.61 ; port J3_pin_61_1V8
J3_pin_62_1V8: J3.62 ; port J3_pin_62_1V8
J3_pin_63_1V8: J3.63 ; port J3_pin_63_1V8
J3_pin_64_1V8: J3.64 ; port J3_pin_64_1V8
J3_pin_66_1V8: J3.66 ; port J3_pin_66_1V8
J3_pin_67_VCCIO5: J3.67 ; port J3_pin_67_VCCIO5
J3_pin_68_1V8: J3.68 ; port J3_pin_68_1V8
J3_pin_69_1V8: J3.69 ; port J3_pin_69_1V8
J3_pin_70_1V8: J3.70 ; port J3_pin_70_1V8
J3_pin_71_1V8: J3.71 ; port J3_pin_71_1V8
J3_pin_72_1V8: J3.72 ; port J3_pin_72_1V8
J3_pin_73_1V8: J3.73 ; port J3_pin_73_1V8
J3_pin_74_VCCIO5: J3.74 ; port J3_pin_74_VCCIO5
J3_pin_75_1V8: J3.75 ; port J3_pin_75_1V8
J3_pin_76_VCCIO5: J3.76 ; port J3_pin_76_VCCIO5
J3_pin_77_1V8: J3.77 ; port J3_pin_77_1V8
J3_pin_78_VCCIO5: J3.78 ; port J3_pin_78_VCCIO5
J3_pin_79_1V8: J3.79 ; port J3_pin_79_1V8
J3_pin_80_VCCIO5: J3.80 ; port J3_pin_80_VCCIO5

### Notes on the sheet
- THIS DOCUMENT AND THE DATA DISCLOSED HEREIN OR
- HEREWITH IS THE PROPERTY OF ALTIUM LIMITED AND MAY
- DWG NO:
- REVISION
- REV:
- DESCRIPTION
- DATE
- APPROVED
- BE FREELY DISTRIBUTED IN WHOLE. NO RIGHTS ARE
- RESERVED OR EXPRESS OR IMPLIED WARANTEE GIVEN.
- ENG:
- APPROVALS
- PROJECT
- DSN:
- CHK:
- REFERENCE DOCUMENTS
- PROJECT REVISION:
- TITLE
- DOCUMENT REVISION:
- DESIGN ITEM:
- BOM:
- FAB DWG:
- PCB DWG:
- ASSY DWG:
- SCALE:
- A3
- SIZE
- CAGE CODE
- FILE NAME
- DWG NO.
- SHEET
- OF
- REV
- (in symbol DF12NA(3.0)-80DS-0.5V(51), part A) Конт.; Цепь
- (in symbol DF12NA(3.0)-80DS-0.5V(51), part B) Конт.; Цепь

### Library data of the parts
J3 = DF12NA(3.0)-80DS-0.5V(51): as J1 on sheet 07_J1_CONN; ComponentLink1Description: Link; ComponentLink2Description: LocalLink; ComponentLink2URL: C:\Users\Public\Documents\Altium\Datasheet\Connectors\DF12NA(3.0)-80DS-0.5V(51).pdf; Type: Board-to-Board; Temperature: -40...+105°C; PartNumber: DF12NA(3.0)-80DS-0.5V(51)

## Sheet 10_J4_CONN.SchDoc
size 420 x 297 mm; SheetNumber: 10; SheetTotal: 10
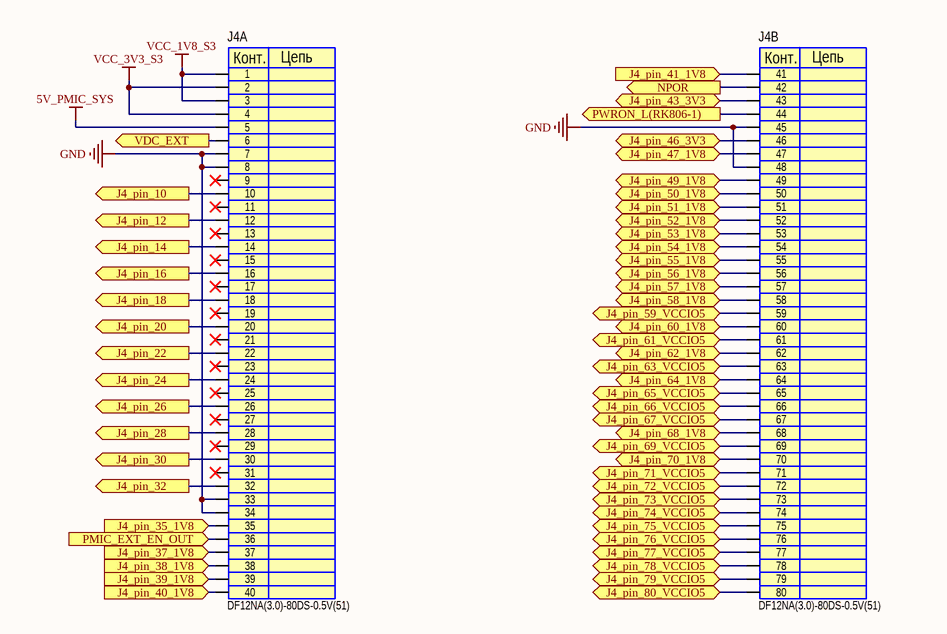
[diagram p22: 10_J4_CONN.SchDoc]

### Parts
J4  DF12NA(3.0)-80DS-0.5V(51)  [CONN_DF12NA3.0-80DS-0.5V51_HIR]  (parts A,B of 2)

### Ports
J4_pin_10 (out), J4_pin_12 (out), J4_pin_14 (out), J4_pin_16 (out), J4_pin_18 (out), J4_pin_20 (out), J4_pin_22 (out), J4_pin_24 (out), J4_pin_26 (out), J4_pin_28 (out), J4_pin_30 (out), J4_pin_32 (out), J4_pin_35_1V8 (in), J4_pin_37_1V8 (in), J4_pin_38_1V8 (in), J4_pin_39_1V8 (in), J4_pin_40_1V8 (in), J4_pin_41_1V8 (in), J4_pin_43_3V3 (bidir), J4_pin_46_3V3 (bidir), J4_pin_47_1V8 (bidir), J4_pin_49_1V8 (bidir), J4_pin_50_1V8 (bidir), J4_pin_51_1V8 (bidir), J4_pin_52_1V8 (bidir), J4_pin_53_1V8 (bidir), J4_pin_54_1V8 (bidir), J4_pin_55_1V8 (bidir), J4_pin_56_1V8 (bidir), J4_pin_57_1V8 (bidir), J4_pin_58_1V8 (bidir), J4_pin_59_VCCIO5 (bidir), J4_pin_60_1V8 (bidir), J4_pin_61_VCCIO5 (bidir), J4_pin_62_1V8 (bidir), J4_pin_63_VCCIO5 (bidir), J4_pin_64_1V8 (bidir), J4_pin_65_VCCIO5 (bidir), J4_pin_66_VCCIO5 (bidir), J4_pin_67_VCCIO5 (bidir), J4_pin_68_1V8 (bidir), J4_pin_69_VCCIO5 (bidir), J4_pin_70_1V8 (bidir), J4_pin_71_VCCIO5 (bidir), J4_pin_72_VCCIO5 (bidir), J4_pin_73_VCCIO5 (bidir), J4_pin_74_VCCIO5 (bidir), J4_pin_75_VCCIO5 (bidir), J4_pin_76_VCCIO5 (bidir), J4_pin_77_VCCIO5 (bidir), J4_pin_78_VCCIO5 (bidir), J4_pin_79_VCCIO5 (bidir), J4_pin_80_VCCIO5 (bidir), NPOR (out), PMIC_EXT_EN_OUT (in), PWRON_L(RK806-1) (out), VDC_EXT (out)

### Nets
5V_PMIC_SYS: J4.5
GND: J4.7 J4.8 J4.33 J4.34 J4.45 J4.48
VCC_1V8_S3: J4.1 J4.3
VCC_3V3_S3: J4.2 J4.4
J4_pin_10: J4.10 ; port J4_pin_10
J4_pin_12: J4.12 ; port J4_pin_12
J4_pin_14: J4.14 ; port J4_pin_14
J4_pin_16: J4.16 ; port J4_pin_16
J4_pin_18: J4.18 ; port J4_pin_18
J4_pin_20: J4.20 ; port J4_pin_20
J4_pin_22: J4.22 ; port J4_pin_22
J4_pin_24: J4.24 ; port J4_pin_24
J4_pin_26: J4.26 ; port J4_pin_26
J4_pin_28: J4.28 ; port J4_pin_28
J4_pin_30: J4.30 ; port J4_pin_30
J4_pin_32: J4.32 ; port J4_pin_32
J4_pin_35_1V8: J4.35 ; port J4_pin_35_1V8
J4_pin_37_1V8: J4.37 ; port J4_pin_37_1V8
J4_pin_38_1V8: J4.38 ; port J4_pin_38_1V8
J4_pin_39_1V8: J4.39 ; port J4_pin_39_1V8
J4_pin_40_1V8: J4.40 ; port J4_pin_40_1V8
J4_pin_41_1V8: J4.41 ; port J4_pin_41_1V8
J4_pin_43_3V3: J4.43 ; port J4_pin_43_3V3
J4_pin_46_3V3: J4.46 ; port J4_pin_46_3V3
J4_pin_47_1V8: J4.47 ; port J4_pin_47_1V8
J4_pin_49_1V8: J4.49 ; port J4_pin_49_1V8
J4_pin_50_1V8: J4.50 ; port J4_pin_50_1V8
J4_pin_51_1V8: J4.51 ; port J4_pin_51_1V8
J4_pin_52_1V8: J4.52 ; port J4_pin_52_1V8
J4_pin_53_1V8: J4.53 ; port J4_pin_53_1V8
J4_pin_54_1V8: J4.54 ; port J4_pin_54_1V8
J4_pin_55_1V8: J4.55 ; port J4_pin_55_1V8
J4_pin_56_1V8: J4.56 ; port J4_pin_56_1V8
J4_pin_57_1V8: J4.57 ; port J4_pin_57_1V8
J4_pin_58_1V8: J4.58 ; port J4_pin_58_1V8
J4_pin_59_VCCIO5: J4.59 ; port J4_pin_59_VCCIO5
J4_pin_60_1V8: J4.60 ; port J4_pin_60_1V8
J4_pin_61_VCCIO5: J4.61 ; port J4_pin_61_VCCIO5
J4_pin_62_1V8: J4.62 ; port J4_pin_62_1V8
J4_pin_63_VCCIO5: J4.63 ; port J4_pin_63_VCCIO5
J4_pin_64_1V8: J4.64 ; port J4_pin_64_1V8
J4_pin_65_VCCIO5: J4.65 ; port J4_pin_65_VCCIO5
J4_pin_66_VCCIO5: J4.66 ; port J4_pin_66_VCCIO5
J4_pin_67_VCCIO5: J4.67 ; port J4_pin_67_VCCIO5
J4_pin_68_1V8: J4.68 ; port J4_pin_68_1V8
J4_pin_69_VCCIO5: J4.69 ; port J4_pin_69_VCCIO5
J4_pin_70_1V8: J4.70 ; port J4_pin_70_1V8
J4_pin_71_VCCIO5: J4.71 ; port J4_pin_71_VCCIO5
J4_pin_72_VCCIO5: J4.72 ; port J4_pin_72_VCCIO5
J4_pin_73_VCCIO5: J4.73 ; port J4_pin_73_VCCIO5
J4_pin_74_VCCIO5: J4.74 ; port J4_pin_74_VCCIO5
J4_pin_75_VCCIO5: J4.75 ; port J4_pin_75_VCCIO5
J4_pin_76_VCCIO5: J4.76 ; port J4_pin_76_VCCIO5
J4_pin_77_VCCIO5: J4.77 ; port J4_pin_77_VCCIO5
J4_pin_78_VCCIO5: J4.78 ; port J4_pin_78_VCCIO5
J4_pin_79_VCCIO5: J4.79 ; port J4_pin_79_VCCIO5
J4_pin_80_VCCIO5: J4.80 ; port J4_pin_80_VCCIO5
NPOR: J4.42 ; port NPOR
PMIC_EXT_EN_OUT: J4.36 ; port PMIC_EXT_EN_OUT
PWRON_L: J4.44 ; port PWRON_L(RK806-1)
VDC_EXT: J4.6 ; port VDC_EXT

Not connected (* = marked no-connect by the designer): J4 9* 11* 13* 15* 17* 19* 21* 23* 25* 27* 29* 31*

### Notes on the sheet
- THIS DOCUMENT AND THE DATA DISCLOSED HEREIN OR
- HEREWITH IS THE PROPERTY OF ALTIUM LIMITED AND MAY
- DWG NO:
- REVISION
- REV:
- DESCRIPTION
- DATE
- APPROVED
- BE FREELY DISTRIBUTED IN WHOLE. NO RIGHTS ARE
- RESERVED OR EXPRESS OR IMPLIED WARANTEE GIVEN.
- ENG:
- APPROVALS
- PROJECT
- DSN:
- CHK:
- REFERENCE DOCUMENTS
- PROJECT REVISION:
- TITLE
- DOCUMENT REVISION:
- DESIGN ITEM:
- BOM:
- FAB DWG:
- PCB DWG:
- ASSY DWG:
- SCALE:
- A3
- SIZE
- CAGE CODE
- FILE NAME
- DWG NO.
- SHEET
- OF
- REV
- (in symbol DF12NA(3.0)-80DS-0.5V(51), part A) Конт.; Цепь
- (in symbol DF12NA(3.0)-80DS-0.5V(51), part B) Конт.; Цепь

### Library data of the parts
J4 = DF12NA(3.0)-80DS-0.5V(51): as J1 on sheet 07_J1_CONN; ComponentLink1Description: Link; ComponentLink2Description: LocalLink; ComponentLink2URL: C:\Users\Public\Documents\Altium\Datasheet\Connectors\DF12NA(3.0)-80DS-0.5V(51).pdf; Type: Board-to-Board; Temperature: -40...+105°C; PartNumber: DF12NA(3.0)-80DS-0.5V(51)

## Nets that join several sheets
5V_PMIC_SYS: 02_PWR_PMIC_RK806-1 (R13.2), 10_J4_CONN (J4.5)
GND: 02_PWR_PMIC_RK806-1 (71 pins), 03_PWR_PMIC_RK860-2_RK860-3 (53 pins), 04_DRAM-LPDDR4X_200P_1X32bit (197 pins), 05_eMMC (23 pins), 06_RK3588MQ (575 pins), 07_J1_CONN (12 pins), 08_J2_CONN (8 pins), 09_J3_CONN (J3.1 J3.39 J3.65), 10_J4_CONN (6 pins)
VCC4V0_SYS: 02_PWR_PMIC_RK806-1 (26 pins), 03_PWR_PMIC_RK860-2_RK860-3 (29 pins), 07_J1_CONN (12 pins)
VCC_1V1_NLDO: 02_PWR_PMIC_RK806-1 (C14.2 C18.2 D1.9 D1.13), 03_PWR_PMIC_RK860-2_RK860-3 (6 pins)
VCCA1V8_IMAGE_P: 02_PWR_PMIC_RK806-1 (C8.2 D1.58), 06_RK3588MQ (13 pins)
VCCA_1V8_P: 02_PWR_PMIC_RK806-1 (C9.2 D1.60), 06_RK3588MQ (26 pins)
VCCA_3V3_S0: 03_PWR_PMIC_RK860-2_RK860-3 (C354.2 D11.5), 07_J1_CONN (J1.21)
VDD_CPU_BIG0: 03_PWR_PMIC_RK860-2_RK860-3 (10 pins), 06_RK3588MQ (19 pins)
VDD_CPU_BIG1: 03_PWR_PMIC_RK860-2_RK860-3 (8 pins), 06_RK3588MQ (19 pins)
VDD_CPU_LIT: 02_PWR_PMIC_RK806-1 (10 pins), 06_RK3588MQ (18 pins)
VDD_DDR: 02_PWR_PMIC_RK806-1 (10 pins), 06_RK3588MQ (22 pins)
VDD_GPU: 02_PWR_PMIC_RK806-1 (10 pins), 06_RK3588MQ (21 pins)
VDD_LOGIC: 02_PWR_PMIC_RK806-1 (10 pins), 06_RK3588MQ (17 pins)
VDD_NPU: 03_PWR_PMIC_RK860-2_RK860-3 (8 pins), 06_RK3588MQ (14 pins)
VDD_VDENC: 02_PWR_PMIC_RK806-1 (10 pins), 06_RK3588MQ (16 pins)
VDDA0V75_IMAGE_P: 02_PWR_PMIC_RK806-1 (C3.2 D1.11), 06_RK3588MQ (9 pins)
VDDA_0V75_P: 02_PWR_PMIC_RK806-1 (C1.2 D1.8), 06_RK3588MQ (9 pins)
VDDA_0V75_PMU_P: 02_PWR_PMIC_RK806-1 (C5.2), 06_RK3588MQ (5 pins)
VDDA_0V85_P: 02_PWR_PMIC_RK806-1 (C2.2 D1.10), 06_RK3588MQ (19 pins)
VDDA_DDR_PLL_P: 02_PWR_PMIC_RK806-1 (C4.2 D1.12), 06_RK3588MQ (C211.2 C236.2 D9.L15 D9.N12)
VDDQ_DDR: 02_PWR_PMIC_RK806-1 (11 pins), 04_DRAM-LPDDR4X_200P_1X32bit (R65.2), 06_RK3588MQ (27 pins)
VOUT6_RK806-1: 02_PWR_PMIC_RK806-1 (8 pins), 04_DRAM-LPDDR4X_200P_1X32bit (79 pins), 06_RK3588MQ (R88.2)
VOUT8_RK806-1: 02_PWR_PMIC_RK806-1 (5 pins), 03_PWR_PMIC_RK860-2_RK860-3 (R35.1), 05_eMMC (7 pins), 06_RK3588MQ (8 pins)
VOUT10_RK806-1: 02_PWR_PMIC_RK806-1 (7 pins), 04_DRAM-LPDDR4X_200P_1X32bit (C181.2 R67.2), 05_eMMC (13 pins), 06_RK3588MQ (27 pins)
CS_RK806-1: 02_PWR_PMIC_RK806-1 (D1.18 R11.2), 06_RK3588MQ (R87.2)
DDR_CH0_A0_A: 04_DRAM-LPDDR4X_200P_1X32bit (D6.H2), 06_RK3588MQ (D9.T7)
DDR_CH0_A0_B: 04_DRAM-LPDDR4X_200P_1X32bit (D6.R2), 06_RK3588MQ (D9.M8)
DDR_CH0_A1_A: 04_DRAM-LPDDR4X_200P_1X32bit (D6.J2), 06_RK3588MQ (D9.T8)
DDR_CH0_A1_B: 04_DRAM-LPDDR4X_200P_1X32bit (D6.P2), 06_RK3588MQ (D9.M5)
DDR_CH0_A2_A: 04_DRAM-LPDDR4X_200P_1X32bit (D6.H9), 06_RK3588MQ (D9.P4)
DDR_CH0_A2_B: 04_DRAM-LPDDR4X_200P_1X32bit (D6.R9), 06_RK3588MQ (D9.N5)
DDR_CH0_A3_A: 04_DRAM-LPDDR4X_200P_1X32bit (D6.H10), 06_RK3588MQ (D9.P5)
DDR_CH0_A3_B: 04_DRAM-LPDDR4X_200P_1X32bit (D6.R10), 06_RK3588MQ (D9.N4)
DDR_CH0_A4_A: 04_DRAM-LPDDR4X_200P_1X32bit (D6.H11), 06_RK3588MQ (D9.R1)
DDR_CH0_A4_B: 04_DRAM-LPDDR4X_200P_1X32bit (D6.R11), 06_RK3588MQ (D9.K1)
DDR_CH0_A5_A: 04_DRAM-LPDDR4X_200P_1X32bit (D6.J11), 06_RK3588MQ (D9.P2)
DDR_CH0_A5_B: 04_DRAM-LPDDR4X_200P_1X32bit (D6.P11), 06_RK3588MQ (D9.L2)
DDR_CH0_CLKA_N: 04_DRAM-LPDDR4X_200P_1X32bit (D6.J9), 06_RK3588MQ (D9.N1)
DDR_CH0_CLKA_P: 04_DRAM-LPDDR4X_200P_1X32bit (D6.J8), 06_RK3588MQ (D9.N2)
DDR_CH0_CLKB_N: 04_DRAM-LPDDR4X_200P_1X32bit (D6.P9), 06_RK3588MQ (D9.M1)
DDR_CH0_CLKB_P: 04_DRAM-LPDDR4X_200P_1X32bit (D6.P8), 06_RK3588MQ (D9.M2)
DDR_CH0_CLKC_N: 04_DRAM-LPDDR4X_200P_1X32bit (D7.J9), 06_RK3588MQ (D9.A12)
DDR_CH0_CLKC_P: 04_DRAM-LPDDR4X_200P_1X32bit (D7.J8), 06_RK3588MQ (D9.B12)
DDR_CH0_DM0_A: 04_DRAM-LPDDR4X_200P_1X32bit (D6.C3), 06_RK3588MQ (D9.Y4)
DDR_CH0_DM0_B: 04_DRAM-LPDDR4X_200P_1X32bit (D6.Y3), 06_RK3588MQ (D9.G4)
DDR_CH0_DM1_A: 04_DRAM-LPDDR4X_200P_1X32bit (D6.C10), 06_RK3588MQ (D9.AB4)
DDR_CH0_DM1_B: 04_DRAM-LPDDR4X_200P_1X32bit (D6.Y10), 06_RK3588MQ (D9.E4)
DDR_CH0_DQ0_A: 04_DRAM-LPDDR4X_200P_1X32bit (D6.B2), 06_RK3588MQ (D9.U1)
DDR_CH0_DQ0_B: 04_DRAM-LPDDR4X_200P_1X32bit (D6.AA2), 06_RK3588MQ (D9.H1)
DDR_CH0_DQ1_A: 04_DRAM-LPDDR4X_200P_1X32bit (D6.C2), 06_RK3588MQ (D9.T2)
DDR_CH0_DQ1_B: 04_DRAM-LPDDR4X_200P_1X32bit (D6.Y2), 06_RK3588MQ (D9.J2)
DDR_CH0_DQ2_A: 04_DRAM-LPDDR4X_200P_1X32bit (D6.E2), 06_RK3588MQ (D9.T1)
DDR_CH0_DQ2_B: 04_DRAM-LPDDR4X_200P_1X32bit (D6.V2), 06_RK3588MQ (D9.J1)
DDR_CH0_DQ3_A: 04_DRAM-LPDDR4X_200P_1X32bit (D6.F2), 06_RK3588MQ (D9.R2)
DDR_CH0_DQ3_B: 04_DRAM-LPDDR4X_200P_1X32bit (D6.U2), 06_RK3588MQ (D9.K2)
DDR_CH0_DQ4_A: 04_DRAM-LPDDR4X_200P_1X32bit (D6.F4), 06_RK3588MQ (D9.W1)
DDR_CH0_DQ4_B: 04_DRAM-LPDDR4X_200P_1X32bit (D6.U4), 06_RK3588MQ (D9.F1)
DDR_CH0_DQ5_A: 04_DRAM-LPDDR4X_200P_1X32bit (D6.E4), 06_RK3588MQ (D9.V2)
DDR_CH0_DQ5_B: 04_DRAM-LPDDR4X_200P_1X32bit (D6.V4), 06_RK3588MQ (D9.G2)
DDR_CH0_DQ6_A: 04_DRAM-LPDDR4X_200P_1X32bit (D6.C4), 06_RK3588MQ (D9.V1)
DDR_CH0_DQ6_B: 04_DRAM-LPDDR4X_200P_1X32bit (D6.Y4), 06_RK3588MQ (D9.G1)
DDR_CH0_DQ7_A: 04_DRAM-LPDDR4X_200P_1X32bit (D6.B4), 06_RK3588MQ (D9.U2)
DDR_CH0_DQ7_B: 04_DRAM-LPDDR4X_200P_1X32bit (D6.AA4), 06_RK3588MQ (D9.H2)
DDR_CH0_DQ8_A: 04_DRAM-LPDDR4X_200P_1X32bit (D6.B11), 06_RK3588MQ (D9.AB2)
DDR_CH0_DQ8_B: 04_DRAM-LPDDR4X_200P_1X32bit (D6.AA11), 06_RK3588MQ (D9.D2)
DDR_CH0_DQ9_A: 04_DRAM-LPDDR4X_200P_1X32bit (D6.C11), 06_RK3588MQ (D9.AB1)
DDR_CH0_DQ9_B: 04_DRAM-LPDDR4X_200P_1X32bit (D6.Y11), 06_RK3588MQ (D9.C1)
DDR_CH0_DQ10_A: 04_DRAM-LPDDR4X_200P_1X32bit (D6.E11), 06_RK3588MQ (D9.AC1)
DDR_CH0_DQ10_B: 04_DRAM-LPDDR4X_200P_1X32bit (D6.V11), 06_RK3588MQ (D9.C2)
DDR_CH0_DQ11_A: 04_DRAM-LPDDR4X_200P_1X32bit (D6.F11), 06_RK3588MQ (D9.AC2)
DDR_CH0_DQ11_B: 04_DRAM-LPDDR4X_200P_1X32bit (D6.U11), 06_RK3588MQ (D9.B1)
DDR_CH0_DQ12_A: 04_DRAM-LPDDR4X_200P_1X32bit (D6.F9), 06_RK3588MQ (D9.Y1)
DDR_CH0_DQ12_B: 04_DRAM-LPDDR4X_200P_1X32bit (D6.U9), 06_RK3588MQ (D9.F2)
DDR_CH0_DQ13_A: 04_DRAM-LPDDR4X_200P_1X32bit (D6.E9), 06_RK3588MQ (D9.Y2)
DDR_CH0_DQ13_B: 04_DRAM-LPDDR4X_200P_1X32bit (D6.V9), 06_RK3588MQ (D9.E1)
DDR_CH0_DQ14_A: 04_DRAM-LPDDR4X_200P_1X32bit (D6.C9), 06_RK3588MQ (D9.AA1)
DDR_CH0_DQ14_B: 04_DRAM-LPDDR4X_200P_1X32bit (D6.Y9), 06_RK3588MQ (D9.E2)
DDR_CH0_DQ15_A: 04_DRAM-LPDDR4X_200P_1X32bit (D6.B9), 06_RK3588MQ (D9.AA2)
DDR_CH0_DQ15_B: 04_DRAM-LPDDR4X_200P_1X32bit (D6.AA9), 06_RK3588MQ (D9.D1)
DDR_CH0_DQS0A_N: 04_DRAM-LPDDR4X_200P_1X32bit (D6.E3), 06_RK3588MQ (D9.U4)
DDR_CH0_DQS0A_P: 04_DRAM-LPDDR4X_200P_1X32bit (D6.D3), 06_RK3588MQ (D9.U5)
DDR_CH0_DQS0B_N: 04_DRAM-LPDDR4X_200P_1X32bit (D6.V3), 06_RK3588MQ (D9.J7)
DDR_CH0_DQS0B_P: 04_DRAM-LPDDR4X_200P_1X32bit (D6.W3), 06_RK3588MQ (D9.J8)
DDR_CH0_DQS1A_N: 04_DRAM-LPDDR4X_200P_1X32bit (D6.E10), 06_RK3588MQ (D9.AA4)
DDR_CH0_DQS1A_P: 04_DRAM-LPDDR4X_200P_1X32bit (D6.D10), 06_RK3588MQ (D9.AA5)
DDR_CH0_DQS1B_N: 04_DRAM-LPDDR4X_200P_1X32bit (D6.V10), 06_RK3588MQ (D9.F4)
DDR_CH0_DQS1B_P: 04_DRAM-LPDDR4X_200P_1X32bit (D6.W10), 06_RK3588MQ (D9.F5)
DDR_CH0_LP4/4X_CKE0/LP5_CS0_A: 04_DRAM-LPDDR4X_200P_1X32bit (R53.1), 06_RK3588MQ (D9.P7)
DDR_CH0_LP4/4X_CKE0/LP5_CS0_B: 04_DRAM-LPDDR4X_200P_1X32bit (R55.1), 06_RK3588MQ (D9.L5)
DDR_CH0_LP4/4X_CS0_A: 04_DRAM-LPDDR4X_200P_1X32bit (D6.H4), 06_RK3588MQ (D9.R6)
DDR_CH0_LP4/4X_CS0_B: 04_DRAM-LPDDR4X_200P_1X32bit (D6.R4), 06_RK3588MQ (D9.L7)
DDR_CH1_LP4/4X_CKE0/LP5_CS0_C: 04_DRAM-LPDDR4X_200P_1X32bit (R61.1), 06_RK3588MQ (D9.D11)
DDR_CH1_LP4/4X_CKE0/LP5_CS0_D: 04_DRAM-LPDDR4X_200P_1X32bit (R63.1), 06_RK3588MQ (D9.D16)
DDR_CH1_LP4/4X_CS0_C: 04_DRAM-LPDDR4X_200P_1X32bit (D7.H4), 06_RK3588MQ (D9.G11)
DDR_CH1_LP4/4X_CS0_D: 04_DRAM-LPDDR4X_200P_1X32bit (D7.R4), 06_RK3588MQ (D9.E19)
DDR_RESET: 04_DRAM-LPDDR4X_200P_1X32bit (C108.2 C159.2 D6.T11 D7.T11), 06_RK3588MQ (D9.T4)
eMMC_CLKOUT: 05_eMMC (C191.2 D8.M6), 06_RK3588MQ (D9.V34)
eMMC_CMD: 05_eMMC (D8.M5 R69.1), 06_RK3588MQ (D9.W34)
eMMC_D0: 05_eMMC (D8.A3 R68.1), 06_RK3588MQ (D9.Y33)
eMMC_D1: 05_eMMC (D8.A4), 06_RK3588MQ (D9.W33)
eMMC_D2: 05_eMMC (D8.A5), 06_RK3588MQ (D9.V32)
eMMC_D3: 05_eMMC (D8.B2), 06_RK3588MQ (D9.AA33)
eMMC_D4: 05_eMMC (D8.B3), 06_RK3588MQ (D9.Y32)
eMMC_D5: 05_eMMC (D8.B4), 06_RK3588MQ (D9.AA32 D9.W32)
eMMC_D7: 05_eMMC (D8.B6), 06_RK3588MQ (D9.V33)
eMMC_DATA_STROBE: 05_eMMC (R72.2), 06_RK3588MQ (D9.Y34)
eMMC_RSTn: 05_eMMC (C192.2 D8.K5 R70.1), 06_RK3588MQ (D9.AA34)
INT_RK806-1: 02_PWR_PMIC_RK806-1 (D1.19 R10.1), 06_RK3588MQ (D9.M30)
J1_pin_22_3V3: 06_RK3588MQ (D9.AK25), 07_J1_CONN (J1.22)
J1_pin_23_3V3: 06_RK3588MQ (D9.AL24), 07_J1_CONN (J1.23)
J1_pin_25_3V3: 06_RK3588MQ (D9.AK24), 07_J1_CONN (J1.25)
J1_pin_27_3V3: 06_RK3588MQ (D9.AJ25), 07_J1_CONN (J1.27)
J1_pin_29_3V3: 06_RK3588MQ (D9.AJ28), 07_J1_CONN (J1.29)
J1_pin_30_3V3: 06_RK3588MQ (D9.AL26), 07_J1_CONN (J1.30)
J1_pin_32_3V3: 06_RK3588MQ (D9.AK30), 07_J1_CONN (J1.32)
J1_pin_33_3V3: 06_RK3588MQ (D9.AK8 D9.AL8), 07_J1_CONN (J1.33)
J1_pin_34_3V3: 06_RK3588MQ (D9.AL30), 07_J1_CONN (J1.34)
J1_pin_36_3V3: 06_RK3588MQ (D9.AJ27), 07_J1_CONN (J1.36)
J1_pin_37_3V3: 06_RK3588MQ (D9.AL14 D9.AM14), 07_J1_CONN (J1.37)
J1_pin_38_3V3: 06_RK3588MQ (D9.AJ26), 07_J1_CONN (J1.38)
J1_pin_40_3V3: 06_RK3588MQ (D9.AM29), 07_J1_CONN (J1.40)
J1_pin_42_3V3: 06_RK3588MQ (D9.AK26), 07_J1_CONN (J1.42)
J1_pin_46_1V8: 06_RK3588MQ (D9.P31), 07_J1_CONN (J1.46)
J1_pin_62_3V3: 06_RK3588MQ (D9.AM27), 07_J1_CONN (J1.62)
J1_pin_64_3V3: 06_RK3588MQ (D9.AL27), 07_J1_CONN (J1.64)
J1_pin_65: 06_RK3588MQ (D9.AK6 D9.AL6), 07_J1_CONN (J1.65)
J1_pin_66: 06_RK3588MQ (D9.AN8), 07_J1_CONN (J1.66)
J1_pin_68: 06_RK3588MQ (D9.AP8), 07_J1_CONN (J1.68)
J1_pin_69: 06_RK3588MQ (D9.AL7 D9.AM7), 07_J1_CONN (J1.69)
J1_pin_70: 06_RK3588MQ (D9.AN9), 07_J1_CONN (J1.70)
J1_pin_72: 06_RK3588MQ (D9.AP9), 07_J1_CONN (J1.72)
J1_pin_73: 06_RK3588MQ (D9.AK9 D9.AL9), 07_J1_CONN (J1.73)
J1_pin_74: 06_RK3588MQ (D9.AN10), 07_J1_CONN (J1.74)
J1_pin_76: 06_RK3588MQ (D9.AP10), 07_J1_CONN (J1.76)
J1_pin_77: 06_RK3588MQ (D9.AL10), 07_J1_CONN (J1.77)
J1_pin_78: 06_RK3588MQ (D9.AN11), 07_J1_CONN (J1.78)
J1_pin_79: 06_RK3588MQ (D9.AM10), 07_J1_CONN (J1.79)
J1_pin_80: 06_RK3588MQ (D9.AP11), 07_J1_CONN (J1.80)
J2_pin_28: 06_RK3588MQ (D9.G33), 08_J2_CONN (J2.28)
J2_pin_30: 06_RK3588MQ (D9.G34), 08_J2_CONN (J2.30)
J2_pin_32: 06_RK3588MQ (D9.D32), 08_J2_CONN (J2.32)
J2_pin_34: 06_RK3588MQ (D9.D33), 08_J2_CONN (J2.34)
J2_pin_36: 06_RK3588MQ (D9.F32), 08_J2_CONN (J2.36)
J2_pin_38: 06_RK3588MQ (D9.F33), 08_J2_CONN (J2.38)
J2_pin_40: 06_RK3588MQ (D9.C33), 08_J2_CONN (J2.40)
J2_pin_41: 06_RK3588MQ (D9.AP16), 08_J2_CONN (J2.41)
J2_pin_42: 06_RK3588MQ (D9.C34), 08_J2_CONN (J2.42)
J2_pin_43: 06_RK3588MQ (D9.AN16), 08_J2_CONN (J2.43)
J2_pin_44: 06_RK3588MQ (D9.E34), 08_J2_CONN (J2.44)
J2_pin_45: 06_RK3588MQ (D9.AP15), 08_J2_CONN (J2.45)
J2_pin_46: 06_RK3588MQ (D9.E33), 08_J2_CONN (J2.46)
J2_pin_47: 06_RK3588MQ (D9.AN15), 08_J2_CONN (J2.47)
J2_pin_49: 06_RK3588MQ (D9.AP14), 08_J2_CONN (J2.49)
J2_pin_50: 06_RK3588MQ (D9.B32), 08_J2_CONN (J2.50)
J2_pin_51: 06_RK3588MQ (D9.AN14), 08_J2_CONN (J2.51)
J2_pin_52: 06_RK3588MQ (D9.A32), 08_J2_CONN (J2.52)
J2_pin_53: 06_RK3588MQ (D9.AP13), 08_J2_CONN (J2.53)
J2_pin_54: 06_RK3588MQ (D9.B30), 08_J2_CONN (J2.54)
J2_pin_55: 06_RK3588MQ (D9.AN13), 08_J2_CONN (J2.55)
J2_pin_56: 06_RK3588MQ (D9.A30), 08_J2_CONN (J2.56)
J2_pin_58: 06_RK3588MQ (D9.C31), 08_J2_CONN (J2.58)
J2_pin_60: 06_RK3588MQ (D9.B31), 08_J2_CONN (J2.60)
J2_pin_62: 06_RK3588MQ (D9.C29), 08_J2_CONN (J2.62)
J2_pin_64: 06_RK3588MQ (D9.B29), 08_J2_CONN (J2.64)
J2_pin_66: 06_RK3588MQ (D9.A28), 08_J2_CONN (J2.66)
J2_pin_68: 06_RK3588MQ (D9.B28), 08_J2_CONN (J2.68)
J2_pin_94_1V8: 06_RK3588MQ (D9.AM15), 08_J2_CONN (J2.94)
J2_pin_96_1V8: 06_RK3588MQ (D9.AL15), 08_J2_CONN (J2.96)
J2_pin_98: 06_RK3588MQ (D9.AL12 D9.AM12), 08_J2_CONN (J2.98)
J3_pin_2_3V3: 06_RK3588MQ (D9.AL28), 09_J3_CONN (J3.2)
J3_pin_3: 06_RK3588MQ (D9.N33), 09_J3_CONN (J3.3)
J3_pin_4_3V3: 06_RK3588MQ (D9.AL29), 09_J3_CONN (J3.4)
J3_pin_5: 06_RK3588MQ (D9.N34), 09_J3_CONN (J3.5)
J3_pin_6_1V8: 06_RK3588MQ (D9.V31), 09_J3_CONN (J3.6)
J3_pin_7: 06_RK3588MQ (D9.M33), 09_J3_CONN (J3.7)
J3_pin_8_1V8: 06_RK3588MQ (D9.W31), 09_J3_CONN (J3.8)
J3_pin_9: 06_RK3588MQ (D9.M34), 09_J3_CONN (J3.9)
J3_pin_10_1V8: 06_RK3588MQ (D9.T31), 09_J3_CONN (J3.10)
J3_pin_11: 06_RK3588MQ (D9.L32), 09_J3_CONN (J3.11)
J3_pin_12_1V8: 06_RK3588MQ (D9.T28), 09_J3_CONN (J3.12)
J3_pin_13: 06_RK3588MQ (D9.L33), 09_J3_CONN (J3.13)
J3_pin_14_1V8: 06_RK3588MQ (D9.V28), 09_J3_CONN (J3.14)
J3_pin_15: 06_RK3588MQ (D9.K33), 09_J3_CONN (J3.15)
J3_pin_16_1V8: 06_RK3588MQ (D9.V29), 09_J3_CONN (J3.16)
J3_pin_17: 06_RK3588MQ (D9.K34), 09_J3_CONN (J3.17)
J3_pin_18_1V8: 06_RK3588MQ (D9.T29), 09_J3_CONN (J3.18)
J3_pin_19: 06_RK3588MQ (D9.J33), 09_J3_CONN (J3.19)
J3_pin_20_VCCIO5: 06_RK3588MQ (D9.Y29), 09_J3_CONN (J3.20)
J3_pin_21: 06_RK3588MQ (D9.J34), 09_J3_CONN (J3.21)
J3_pin_22_VCCIO5: 06_RK3588MQ (D9.AA27), 09_J3_CONN (J3.22)
J3_pin_23: 06_RK3588MQ (D9.H32), 09_J3_CONN (J3.23)
J3_pin_24_1V8: 06_RK3588MQ (D9.G29), 09_J3_CONN (J3.24)
J3_pin_25: 06_RK3588MQ (D9.H33), 09_J3_CONN (J3.25)
J3_pin_26_1V8: 06_RK3588MQ (D9.G27), 09_J3_CONN (J3.26)
J3_pin_27: 06_RK3588MQ (D9.J31), 09_J3_CONN (J3.27)
J3_pin_29: 06_RK3588MQ (D9.J30), 09_J3_CONN (J3.29)
J3_pin_31: 06_RK3588MQ (D9.H30), 09_J3_CONN (J3.31)
J3_pin_32_VCCIO5: 06_RK3588MQ (D9.Y27), 09_J3_CONN (J3.32)
J3_pin_33: 06_RK3588MQ (D9.H29), 09_J3_CONN (J3.33)
J3_pin_34_1V8: 06_RK3588MQ (D9.R30), 09_J3_CONN (J3.34)
J3_pin_35: 06_RK3588MQ (D9.G31), 09_J3_CONN (J3.35)
J3_pin_36_1V8: 06_RK3588MQ (D9.P30), 09_J3_CONN (J3.36)
J3_pin_37: 06_RK3588MQ (D9.G30), 09_J3_CONN (J3.37)
J3_pin_38_1V8: 06_RK3588MQ (D9.K29), 09_J3_CONN (J3.38)
J3_pin_40_1V8: 06_RK3588MQ (D9.L30), 09_J3_CONN (J3.40)
J3_pin_41_1V8: 06_RK3588MQ (D9.AB31), 09_J3_CONN (J3.41)
J3_pin_42_1V8: 06_RK3588MQ (D9.P33), 09_J3_CONN (J3.42)
J3_pin_43_1V8: 06_RK3588MQ (D9.F30), 09_J3_CONN (J3.43)
J3_pin_44_1V8: 06_RK3588MQ (D9.A27), 09_J3_CONN (J3.44)
J3_pin_45_1V8: 06_RK3588MQ (D9.E29), 09_J3_CONN (J3.45)
J3_pin_46_1V8: 06_RK3588MQ (D9.B26), 09_J3_CONN (J3.46)
J3_pin_47_1V8: 06_RK3588MQ (D9.E31), 09_J3_CONN (J3.47)
J3_pin_48_1V8: 06_RK3588MQ (D9.A26), 09_J3_CONN (J3.48)
J3_pin_49_1V8: 06_RK3588MQ (D9.D30), 09_J3_CONN (J3.49)
J3_pin_50_1V8: 06_RK3588MQ (D9.B25), 09_J3_CONN (J3.50)
J3_pin_51_1V8: 06_RK3588MQ (D9.D28), 09_J3_CONN (J3.51)
J3_pin_52_1V8: 06_RK3588MQ (D9.A25), 09_J3_CONN (J3.52)
J3_pin_53_1V8: 06_RK3588MQ (D9.D29), 09_J3_CONN (J3.53)
J3_pin_54_1V8: 06_RK3588MQ (D9.A24), 09_J3_CONN (J3.54)
J3_pin_55_1V8: 06_RK3588MQ (D9.E30), 09_J3_CONN (J3.55)
J3_pin_56_1V8: 06_RK3588MQ (D9.F28), 09_J3_CONN (J3.56)
J3_pin_57_1V8: 06_RK3588MQ (D9.E27), 09_J3_CONN (J3.57)
J3_pin_58_1V8: 06_RK3588MQ (D9.G26), 09_J3_CONN (J3.58)
J3_pin_59_1V8: 06_RK3588MQ (D9.E26), 09_J3_CONN (J3.59)
J3_pin_60_1V8: 06_RK3588MQ (D9.E28), 09_J3_CONN (J3.60)
J3_pin_61_1V8: 06_RK3588MQ (D9.F25), 09_J3_CONN (J3.61)
J3_pin_62_1V8: 06_RK3588MQ (D9.F27), 09_J3_CONN (J3.62)
J3_pin_63_1V8: 06_RK3588MQ (D9.F24), 09_J3_CONN (J3.63)
J3_pin_64_1V8: 06_RK3588MQ (D9.F26), 09_J3_CONN (J3.64)
J3_pin_66_1V8: 06_RK3588MQ (D9.C27), 09_J3_CONN (J3.66)
J3_pin_67_VCCIO5: 06_RK3588MQ (D9.AB28), 09_J3_CONN (J3.67)
J3_pin_68_1V8: 06_RK3588MQ (D9.D27), 09_J3_CONN (J3.68)
J3_pin_69_1V8: 06_RK3588MQ (D9.AB30), 09_J3_CONN (J3.69)
J3_pin_70_1V8: 06_RK3588MQ (D9.D26), 09_J3_CONN (J3.70)
J3_pin_71_1V8: 06_RK3588MQ (D9.AC30), 09_J3_CONN (J3.71)
J3_pin_72_1V8: 06_RK3588MQ (D9.E25), 09_J3_CONN (J3.72)
J3_pin_73_1V8: 06_RK3588MQ (D9.D25), 09_J3_CONN (J3.73)
J3_pin_74_VCCIO5: 06_RK3588MQ (D9.AE28), 09_J3_CONN (J3.74)
J3_pin_75_1V8: 06_RK3588MQ (D9.C25), 09_J3_CONN (J3.75)
J3_pin_76_VCCIO5: 06_RK3588MQ (D9.AJ24), 09_J3_CONN (J3.76)
J3_pin_77_1V8: 06_RK3588MQ (D9.C24), 09_J3_CONN (J3.77)
J3_pin_78_VCCIO5: 06_RK3588MQ (D9.AH24), 09_J3_CONN (J3.78)
J3_pin_79_1V8: 06_RK3588MQ (D9.E24), 09_J3_CONN (J3.79)
J3_pin_80_VCCIO5: 06_RK3588MQ (D10.6 R93.2), 09_J3_CONN (J3.80)
J4_pin_10: 06_RK3588MQ (D9.AM33 D9.AM34), 10_J4_CONN (J4.10)
J4_pin_14: 06_RK3588MQ (D9.AL33 D9.AL34), 10_J4_CONN (J4.14)
J4_pin_18: 06_RK3588MQ (D9.AK33 D9.AK34), 10_J4_CONN (J4.18)
J4_pin_22: 06_RK3588MQ (D9.AJ33 D9.AJ34), 10_J4_CONN (J4.22)
J4_pin_26: 06_RK3588MQ (D9.AH33 D9.AH34), 10_J4_CONN (J4.26)
J4_pin_30: 06_RK3588MQ (D9.AG33 D9.AG34), 10_J4_CONN (J4.30)
J4_pin_35_1V8: 06_RK3588MQ (D9.AN17), 10_J4_CONN (J4.35)
J4_pin_37_1V8: 06_RK3588MQ (D9.AM16), 10_J4_CONN (J4.37)
J4_pin_38_1V8: 06_RK3588MQ (D9.U33), 10_J4_CONN (J4.38)
J4_pin_39_1V8: 06_RK3588MQ (D9.AL16), 10_J4_CONN (J4.39)
J4_pin_40_1V8: 06_RK3588MQ (D9.AF33), 10_J4_CONN (J4.40)
J4_pin_41_1V8: 06_RK3588MQ (D9.AK17), 10_J4_CONN (J4.41)
J4_pin_43_3V3: 06_RK3588MQ (D9.AK27), 10_J4_CONN (J4.43)
J4_pin_46_3V3: 06_RK3588MQ (D9.AM25), 10_J4_CONN (J4.46)
J4_pin_47_1V8: 06_RK3588MQ (D9.AE33), 10_J4_CONN (J4.47)
J4_pin_49_1V8: 06_RK3588MQ (D9.AE34), 10_J4_CONN (J4.49)
J4_pin_50_1V8: 06_RK3588MQ (D9.AD30), 10_J4_CONN (J4.50)
J4_pin_51_1V8: 06_RK3588MQ (D9.AD33), 10_J4_CONN (J4.51)
J4_pin_52_1V8: 06_RK3588MQ (D9.AE31), 10_J4_CONN (J4.52)
J4_pin_53_1V8: 06_RK3588MQ (D9.AD34), 10_J4_CONN (J4.53)
J4_pin_54_1V8: 06_RK3588MQ (D9.AE32), 10_J4_CONN (J4.54)
J4_pin_55_1V8: 06_RK3588MQ (D9.AC33), 10_J4_CONN (J4.55)
J4_pin_56_1V8: 06_RK3588MQ (D9.AD31), 10_J4_CONN (J4.56)
J4_pin_57_1V8: 06_RK3588MQ (D9.AC34), 10_J4_CONN (J4.57)
J4_pin_58_1V8: 06_RK3588MQ (D9.AD32), 10_J4_CONN (J4.58)
J4_pin_59_VCCIO5: 06_RK3588MQ (D9.AH30), 10_J4_CONN (J4.59)
J4_pin_60_1V8: 06_RK3588MQ (D9.AC31), 10_J4_CONN (J4.60)
J4_pin_61_VCCIO5: 06_RK3588MQ (D9.AH29), 10_J4_CONN (J4.61)
J4_pin_62_1V8: 06_RK3588MQ (D9.AC32), 10_J4_CONN (J4.62)
J4_pin_63_VCCIO5: 06_RK3588MQ (D9.AG29), 10_J4_CONN (J4.63)
J4_pin_64_1V8: 06_RK3588MQ (D9.AF34), 10_J4_CONN (J4.64)
J4_pin_65_VCCIO5: 06_RK3588MQ (D9.AG28), 10_J4_CONN (J4.65)
J4_pin_66_VCCIO5: 06_RK3588MQ (D9.AH27), 10_J4_CONN (J4.66)
J4_pin_67_VCCIO5: 06_RK3588MQ (D9.AE27), 10_J4_CONN (J4.67)
J4_pin_68_1V8: 06_RK3588MQ (D9.AB33), 10_J4_CONN (J4.68)
J4_pin_69_VCCIO5: 06_RK3588MQ (D9.AD27), 10_J4_CONN (J4.69)
J4_pin_70_1V8: 06_RK3588MQ (D9.AB34), 10_J4_CONN (J4.70)
J4_pin_71_VCCIO5: 06_RK3588MQ (D9.AD28), 10_J4_CONN (J4.71)
J4_pin_72_VCCIO5: 06_RK3588MQ (D9.AE29), 10_J4_CONN (J4.72)
J4_pin_73_VCCIO5: 06_RK3588MQ (D9.AC28), 10_J4_CONN (J4.73)
J4_pin_74_VCCIO5: 06_RK3588MQ (D9.AD29), 10_J4_CONN (J4.74)
J4_pin_75_VCCIO5: 06_RK3588MQ (D9.AC29), 10_J4_CONN (J4.75)
J4_pin_76_VCCIO5: 06_RK3588MQ (D9.Y31), 10_J4_CONN (J4.76)
J4_pin_77_VCCIO5: 06_RK3588MQ (D9.AA30), 10_J4_CONN (J4.77)
J4_pin_78_VCCIO5: 06_RK3588MQ (D9.Y30), 10_J4_CONN (J4.78)
J4_pin_79_VCCIO5: 06_RK3588MQ (D9.AA29), 10_J4_CONN (J4.79)
J4_pin_80_VCCIO5: 06_RK3588MQ (D9.AA28), 10_J4_CONN (J4.80)
MISO_RK806-1: 02_PWR_PMIC_RK806-1 (D1.16), 06_RK3588MQ (R78.2 R79.2 R80.2)
NPOR: 02_PWR_PMIC_RK806-1 (C?.2 D1.40 R9.1), 06_RK3588MQ (R92.2), 10_J4_CONN (J4.42)
PMIC_EXT_EN_OUT: 03_PWR_PMIC_RK860-2_RK860-3 (R41.1), 10_J4_CONN (J4.36)
PMIC_SPI_MOSI: 02_PWR_PMIC_RK806-1 (D1.15 R12.1), 06_RK3588MQ (R77.2 R91.1)
PWRON_L: 02_PWR_PMIC_RK806-1 (D1.4), 10_J4_CONN (J4.44)
VDC_EXT: 02_PWR_PMIC_RK806-1 (C16.2 D1.32 R13.1 R14.2), 10_J4_CONN (J4.6)
VSEL2: 03_PWR_PMIC_RK860-2_RK860-3 (D2.A1), 06_RK3588MQ (D9.R31)
VSEL3: 03_PWR_PMIC_RK860-2_RK860-3 (D3.A1 D4.A1), 06_RK3588MQ (D9.U32)